# Altium schematic sheet 4_PP5V Bias.SchDoc
size A2; Date: Not shown in title block; ApprovedBy: Not shown in title block; CheckedBy: Not shown in title block; Author: Not shown in title block; CompanyName: Not shown in title block; Engineer: Not shown in title block; Organization: Not shown in title block; Address1: Not shown in title block; Address2: Not shown in title block; Address3: Not shown in title block; Address4: Not shown in title block; DocumentNumber: 1; Revision: Use project parameter SCH_Rev; SheetNumber: 1; SheetTotal: 1; PageSetup: Record=PageOptions|CenterHorizontal=True|CenterVertical=True|PrintScale=0.69|XCorrection=1.00|YCorrection=1.00|PrintKind=0|BorderSize=5000000|LeftOffset=0|BottomOffset=0|Orientation=2|PaperLength=1000|PaperWidth=1000|Scale=100|PaperSource=15|PrintQuality=600|MediaType=1|DitherType=10|PaperKind=Letter|PrintScaleMode=1; CurrentTime: Not shown in title block; CurrentDate: Not shown in title block; Time: Not shown in title block; DocumentFullPathAndName: Not shown in title block; DocumentName: Not shown in title block; ModifiedDate: Not shown in title block; ImagePath: Not shown in title block
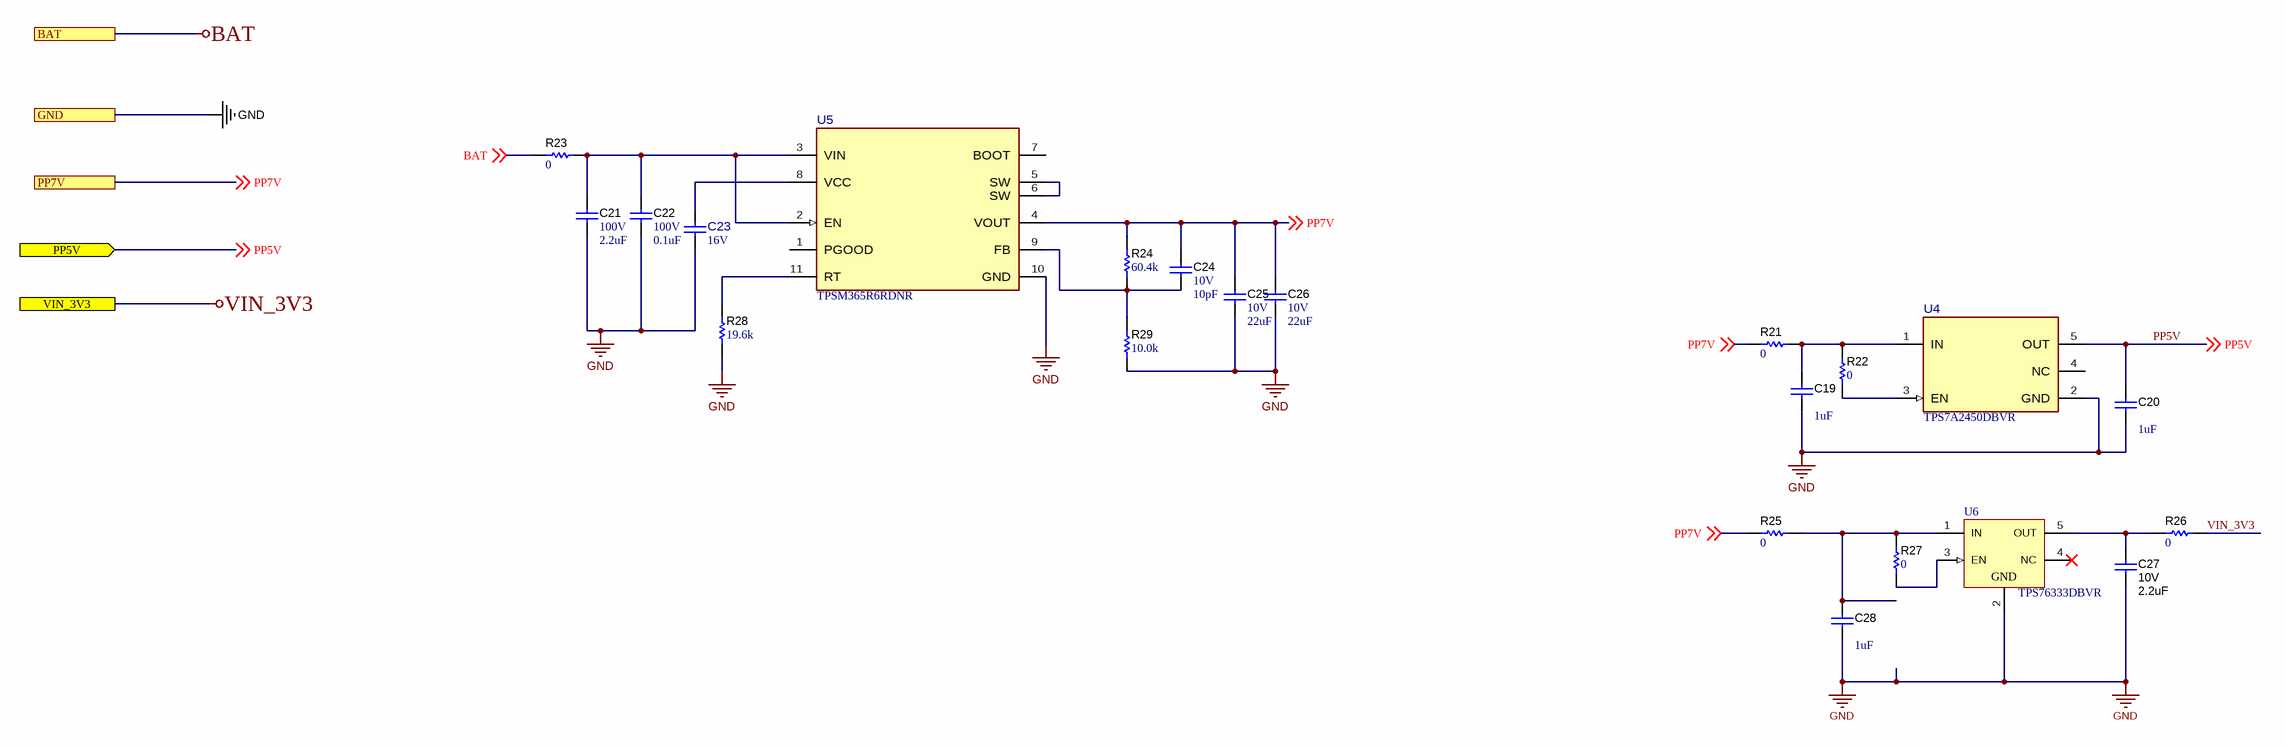
[diagram p0: 4_PP5V Bias.SchDoc]

## Parts
C19  ValueDisplayed: 1uF  [0805_HV]  (hidden comment: C2012X7S2A105K125AB)
C20  ValueDisplayed: 1uF  [0805_HV]  (hidden comment: C2012X7S2A105K125AB)
C21  VDC_V: 100V  ValueDisplayed: 2.2uF  [1206_180]  (hidden comment: C3216X7S2A225K160AB)
C22  VDC_V: 100V  ValueDisplayed: 0.1uF  [0402]  (hidden comment: GRM155R62A104KE14D)
C23  VDC_V: 16V  [FP-0402YD105KAT2A_0402-IPC_B]  (hidden comment: 0402YD105KAT2A)
C24  VDC_V: 10V  ValueDisplayed: 10pF  [0402]  (hidden comment: C0402C100C8GACTU)
C25  VDC_V: 10V  ValueDisplayed: 22uF  [0603]  (hidden comment: CL10A226MP8NUNE)
C26  VDC_V: 10V  ValueDisplayed: 22uF  [0603]  (hidden comment: CL10A226MP8NUNE)
C27  VDC_V: 10V  ValueDisplayed: 2.2uF  [0603]  (hidden comment: CGA3E3X5R1A225K080AB)
C28  ValueDisplayed: 1uF  [0805_HV]  (hidden comment: C2012X7S2A105K125AB)
R21  ValueDisplayed: 0  [0603]  (hidden comment: RC0603JR-070RL)
R22  ValueDisplayed: 0  [0402]  (hidden comment: CMP-0027004-2)
R23  ValueDisplayed: 0  [0402]  (hidden comment: CMP-0027004-2)
R24  ValueDisplayed: 60.4k  [0603]  (hidden comment: RT0603BRD0760K4L)
R25  ValueDisplayed: 0  [0603]  (hidden comment: RC0603JR-070RL)
R26  ValueDisplayed: 0  [0402]  (hidden comment: CMP-0027004-2)
R27  ValueDisplayed: 0  [0402]  (hidden comment: CMP-0027004-2)
R28  ValueDisplayed: 19.6k  [0402]  (hidden comment: CRCW040219K6FKED)
R29  ValueDisplayed: 10.0k  [0402]  (hidden comment: ERJ-2RKF1002X)
U4  TPS7A2450DBVR  [DBV0005A-MFG]
U5  TPSM365R6RDNR  [RDN0011A-MFG]
U6  TPS76333DBVR  [DBV0005A_N]

## Ports
BAT, GND, PP5V (in), PP7V, VIN_3V3

## Nets
BAT: R23.2 ; off-sheet BAT, port BAT
GND: C19.2 C20.2 C21.2 C22.2 C23.2 C25.2 C26.2 C27.2 C28.2 R28.1 R29.1 U4.2(GND) U5.10(GND) U6.2(GND) ; port GND
VIN_3V3: R26.1 ; port VIN_3V3
PP5V: C20.1 U4.5(OUT) ; off-sheet PP5V, port PP5V
PP7V: C24.1 C25.1 C26.1 R21.1 R24.2 R25.1 U5.4(VOUT) ; off-sheet PP7V, port PP7V
NetC19_1: C19.1 R21.2 R22.2 U4.1(IN)
NetC21_1: C21.1 C22.1 R23.1 U5.2(EN) U5.3(VIN)
NetC23_1: C23.1 U5.8(VCC)
NetC24_2: C24.2 R24.1 R29.2 U5.9(FB)
NetC27_1: C27.1 R26.2 U6.5(OUT)
NetC28_1: C28.1 R25.2 R27.2 U6.1(IN)
NetR22_1: R22.1 U4.3(EN)
NetR27_1: R27.1 U6.3(EN)
NetR28_2: R28.2 U5.11(RT)
NetU5_5: U5.5(SW) U5.6(SW)

Not connected (* = marked no-connect by the designer): U4 4(NC); U5 1(PGOOD) 7(BOOT); U6 4(NC)*

## Notes on the sheet
- Orderable:
- Designed for:
- Mod. Date:
- Texas Instruments and/or its licensors do not warrant the accuracy or completeness of this specification or any information contained therein. Texas Instruments and/or its licensors do not warrant that this design will meet the specifications, will be suitable for your application or fit for any particular purpose, or will operate in an implementation. Texas Instruments and/or its licensors do not warrant that the design is production worthy. You should completely validate and test your design implementation to confirm the system functionality for your application.
- Drawn By:
- Engineer:
- SVN Rev:
- Number:
- TID #:
- Rev:
- Sheet Title:
- File:
- Contact:
- Project Title:
- Assembly Variant:
- Sheet:
- Size:
- of
- A2
- © Texas Instruments
- http://www.ti.com

## Library data of the parts
C19 C20 C28 = CMP-0007891-2: CAP, CERM, 1 uF, 100 V, +/- 10%, X7S, 0805; Manufacturer: TDK; TaMin_C: -55°C; Polarized: N; SizeAreaWB_mm2: 6.75; Value1: 0.008255 ohm; U/M: EA; Value: 1uF; TaMax_C: 125°C; SizeZ_mm: 1.45; SizeX_mm: 2; SizeY_mm: 1.25; Cap_Case: 0805; Value2: 100V; SizeArea_mm2: 2.5; Cap_F: 1µF; AEC Category: Q200; ESR_ohm: 8.255m; IRMS_A: 2.2744A; Supplier Part Number 2: 90R8332; Publisher: Texas Instruments; Supplier 2: Newark; Supplier Part Number 3: 810-C2012X7S2A105K; TempCo: X7S; Supplier 3: Mouser; Published: 2008-06-19; RoHS: Y; MountType: SMT; Supplier 1: Digi-Key; PackageReference: 0805; Tolerance_%: 10%; CompType: Capacitor; LatestRevisionDate: 2017-03-09; PartNumber: C2012X7S2A105K125AB; AEC Qualified: N; VDC_V: 100V; ComponentLink1Description: Datasheet link; Supplier Part Number 1: 445-5205-1-ND; Technology: Ceramic; ComponentLink1URL: https://product.tdk.com/en/search/capacitor/ceramic/mlcc/info?part_no=C2012X7S2A105K125AB; AEC Grade: N/A
C21 = CMP-0008724-2: CAP, CERM, 2.2 uF, 100 V, +/- 10%, X7S, 1206; Manufacturer: TDK; TaMin_C: -55°C; ESR_ohm: 5.718m; Polarized: N; SizeAreaWB_mm2: 10.92; Value1: 0.005718 ohm; U/M: EA; Value: 2.2uF; TaMax_C: 125°C; SizeZ_mm: 1.8; SizeX_mm: 3.2; SizeY_mm: 1.6; SizeArea_mm2: 5.12; Cap_F: 2.2µF; IRMS_A: 3.0363A; AEC Category: Q200; Supplier Part Number 2: 810-C3216X7S2A225K160AB; Publisher: Texas Instruments; Supplier 2: Mouser; TempCo: X7S; Published: 2008-06-19; RoHS: Y; MountType: SMT; Supplier 1: Digi-Key; PackageReference: 1206; Tolerance_%: 10%; Cap_Case: 1206_180; Value2: 100V; CompType: Capacitor; LatestRevisionDate: 2017-03-09; PartNumber: C3216X7S2A225K160AB; AEC Qualified: N; ComponentLink1Description: Datasheet link; AEC Grade: N/A; Supplier Part Number 1: 445-5207-1-ND; Technology: Ceramic; ComponentLink1URL: https://product.tdk.com/en/search/capacitor/ceramic/mlcc/info?part_no=C3216X7S2A225K160AB
C22 = CMP-0006618-1: CAP, CERM, 0.1 uF, 100 V, +/- 10%, X5R, 0402; Manufacturer: MuRata; TaMin_C: -55°C; Polarized: N; SizeAreaWB_mm2: 3; Value1: Unknown; U/M: EA; Value: 0.1uF; TaMax_C: 85°C; SizeZ_mm: 0.6; SizeX_mm: 1; SizeY_mm: 0.5; Cap_F: 100nF; AEC Category: Q200; ComponentLink1URL: http://psearch.en.murata.com/capacitor/product/GRM155R62A104KE14%23.pdf; Supplier Part Number 2: 96Y9228; Publisher: Texas Instruments; Supplier 2: Newark; Supplier Part Number 3: 81-GRM155R62A104KE4D; TempCo: X5R; Supplier 3: Mouser; Published: 2008-06-19; RoHS: Y; MountType: SMT; Supplier 1: Digi-Key; PackageReference: 0402; Tolerance_%: 10%; Cap_Case: 0402; Value2: 100V; SizeArea_mm2: 0.5; CompType: Capacitor; LatestRevisionDate: 2017-03-09; PartNumber: GRM155R62A104KE14D; AEC Qualified: N; ComponentLink1Description: Datasheet link; AEC Grade: N/A; Supplier Part Number 1: 490-10458-1-ND; Technology: Ceramic
C23 = CMP-00860000-2: CAPACITOR, X5R, 0402, 16V, 1UF; Manufacturer: AVX; SizeZ_mm: 0.56mm; Value: 1µF; TempCo: 15%; Tolerance_%: 10%; AEC Qualified: No; Symbol Name: SYM-0402YD105KAT2A; ComponentLink1URL: http://datasheets.avx.com/cx5r.pdf; PackageReference: 0402; PartNumber: 0402YD105KAT2A; ComponentLink1Description: Datasheet; RoHS: TRUE
C24 = CMP-0064914-1: CAP, CERM, 10 pF, 10 V,+/- 2.5%, C0G/NP0, 0402; Manufacturer: Kemet; TaMin_C: -55°C; Polarized: N; SizeAreaWB_mm2: 3; Value1: Unknown; U/M: EA; Value: 10pF; TaMax_C: 125°C; SizeZ_mm: 0.6; SizeX_mm: 1; SizeY_mm: 0.5; AEC Category: Q200; ComponentLink1URL: http://www.kemet.com/docfinder?Partnumber=C0402C100C8GACTU; Supplier Part Number 2: 96Y6847; Publisher: Texas Instruments; Supplier 2: Newark; Supplier Part Number 3: 80-C0402C100C8G; TempCo: C0G/NP0; Supplier 3: Mouser; Published: 2008-06-19; RoHS: Y; MountType: SMT; Supplier 1: Digi-Key; PackageReference: 0402; Tolerance_%: 2.5%; Cap_Case: 0402; Value2: 10V; SizeArea_mm2: 0.5; CompType: Capacitor; LatestRevisionDate: 2017-06-05; PartNumber: C0402C100C8GACTU; AEC Qualified: N; Cap_F: 10pF; ComponentLink1Description: Datasheet link; AEC Grade: N/A; Supplier Part Number 1: 399-8939-1-ND; Technology: Ceramic
C25 C26 = CMP-0007108-2: CAP, CERM, 22 uF, 10 V, +/- 20%, X5R, 0603; Manufacturer: Samsung Electro-Mechanics; TaMin_C: -55°C; Polarized: N; SizeAreaWB_mm2: 4.68; Value1: Unknown; U/M: EA; Value: 22uF; TaMax_C: 85°C; SizeZ_mm: 1; SizeX_mm: 1.6; SizeY_mm: 0.8; SizeArea_mm2: 1.28; Cap_F: 22µF; AEC Category: Q200; Publisher: Texas Instruments; TempCo: X5R; Published: 2008-06-19; RoHS: Y; MountType: SMT; PackageReference: 0603; Tolerance_%: 20%; Cap_Case: 0603; Value2: 10V; CompType: Capacitor; LatestRevisionDate: 2017-03-09; PartNumber: CL10A226MP8NUNE; AEC Qualified: ?; ComponentLink1Description: Datasheet link; Technology: Ceramic; ComponentLink1URL: http://www.samsungsem.com/servlet/FileDownload?type=spec&file=CL10A226MP8NUNE.pdf
C27 = CMP-0007091-5: CAP, CERM, 2.2 uF, 10 V, +/- 10%, X5R, AEC-Q200 Grade 3, 0603; Manufacturer: TDK; TaMin_C: -55°C; Polarized: N; SizeAreaWB_mm2: 4.68; Value1: Unknown; U/M: EA; Value: 2.2uF; TaMax_C: 85°C; SizeZ_mm: 1; SizeX_mm: 1.6; SizeY_mm: 0.8; SizeArea_mm2: 1.28; AEC Qualified: Y; Cap_F: 2.2µF; AEC Grade: 3; AEC Category: Q200; ComponentLink1URL: https://product.tdk.com/info/en/documents/chara_sheet/CGA3E3X5R1A225K080AB.pdf; Publisher: Texas Instruments; Supplier 2: Newark; Supplier Part Number 3: 810-CGA3E3X5R1A225KB; TempCo: X5R; Supplier 3: Mouser; Published: 2008-06-19; RoHS: Y; MountType: SMT; Supplier 1: Digi-Key; PackageReference: 0603; Tolerance_%: 10%; Cap_Case: 0603; Value2: 10V; CompType: Capacitor; LatestRevisionDate: 2017-03-09; PartNumber: CGA3E3X5R1A225K080AB; ComponentLink1Description: Datasheet link; Supplier Part Number 1: 445-12444-1-ND; Technology: Ceramic
R21 R25 = CMP-0025885-5: RES, 0, 5%, 0.1 W, 0603; Manufacturer: Yageo; Power_W: 100mW; TempCo: 200 ppm/C; Value_Code: 0000; Value: 0; EIA_Code: E24; SizeX_mm: 1.6; SizeZ_mm: 1; Value2: 0.1W; SizeArea_mm2: 1.28; AEC Qualified: N; VDC_V: 75V; AEC Category: Q200; SizeY_mm: 0.8; SizeAreaWB_mm2: 4.68; Supplier Part Number 2: 603-RC0603JR-070RL; Supplier 2: Mouser; Supplier Part Number 3: 9233130; Supplier 3: Farnell; RoHS: Y; Value1: 5%; MountType: SMT; Supplier 1: Digi-Key; PackageReference: 0603; Tolerance_%: 5%; Res_ohm: 0; CompType: Resistor; PartNumber: RC0603JR-070RL; ComponentLink1Description: Datasheet link; Supplier Part Number 1: 311-0.0GRCT-ND; Technology: Thick Film; ComponentLink1URL: http://www.yageo.com/pdf/Pu-RC0603_51_PbFree_L_2.pdf; AEC Grade: N/A
R22 R23 R26 R27 = CMP-0027004-2: RES, 0, 5%, 0.063 W, 0402; PartNumber: RC0402JR-070RL; Manufacturer: Yageo America; Value: 0; Value_Code: 0000; Power_W: 63mW; Value2: 0.063W; VDC_V: 50V; TempCo: 200 ppm/C; SizeArea_mm2: 0.5; SizeX_mm: 1; SizeZ_mm: 0.6; EIA_Code: E24; U/M: EA; AEC Category: Q200; CompType: Resistor; PackageReference: 0402; RoHS: Y; Res_ohm: 0; Tolerance_%: 5%; Value1: 5%; MountType: SMT; Technology: Thick Film; SizeY_mm: 0.5; Published: 2008-06-26; Publisher: Texas Instruments; LatestRevisionDate: 2017-03-09; ComponentLink1Description: Datasheet link; ComponentLink1URL: http://www.yageo.com/pdf/Pu-RC0402_51_PbFree_L_2.pdf; Supplier 1: Digi-Key; Supplier Part Number 1: 311-0.0JRCT-ND; Supplier 2: Mouser; Supplier Part Number 2: 603-RC0402JR-070RL; Supplier 3: Farnell; Supplier Part Number 3: 9232516; AEC Qualified: ?
R24 = CMP-0024382-2: RES, 60.4 k, 0.1%, 0.1 W, 0603; Manufacturer: Yageo America; Power_W: 100mW; TempCo: 25 ppm/C; Value_Code: 60k4; U/M: EA; Value: 60.4k; EIA_Code: E192; SizeX_mm: 1.6; SizeY_mm: 0.8; SizeZ_mm: 1; Value2: 0.1W; SizeArea_mm2: 1.28; VDC_V: 75V; AEC Category: Q200; Publisher: Texas Instruments; Published: 2008-06-26; RoHS: Y; Value1: 0.1%; MountType: SMT; PackageReference: 0603; Tolerance_%: 0.1%; Res_ohm: 60.4k; CompType: Resistor; LatestRevisionDate: 2017-03-09; PartNumber: RT0603BRD0760K4L; AEC Qualified: ?; ComponentLink1Description: Datasheet link; Technology: Thin Film; ComponentLink1URL: http://www.yageo.com/pdf/PYu-RT_1-to-0.05_RoHS_L_3.pdf
R28 = CMP-0026068-2: RES, 19.6 k, 1%, 0.063 W, 0402; Manufacturer: Vishay-Dale; Power_W: 63mW; TempCo: 100 ppm/C; Value_Code: 19k6; U/M: EA; Value: 19.6k; EIA_Code: E96; SizeX_mm: 1; SizeY_mm: 0.5; SizeZ_mm: 0.6; Value2: 0.063W; VDC_V: 50V; AEC Category: Q200; Supplier Part Number 2: 52K6774; Publisher: Texas Instruments; Supplier 2: Newark; Supplier Part Number 3: 71-CRCW0402-19.6K-E3; Supplier 3: Mouser; Published: 2008-06-26; RoHS: Y; Value1: 1%; MountType: SMT; Supplier 1: Digi-Key; PackageReference: 0402; Tolerance_%: 1%; Res_ohm: 19.6k; SizeArea_mm2: 0.5; CompType: Resistor; LatestRevisionDate: 2017-03-09; PartNumber: CRCW040219K6FKED; AEC Qualified: ?; ComponentLink1Description: Datasheet link; Supplier Part Number 1: 541-19.6KLCT-ND; Technology: Thick Film; ComponentLink1URL: http://www.vishay.com/docs/20035/dcrcwe3.pdf
R29 = CMP-0026658-1: RES, 10.0 k, 1%, 0.1 W, 0402; Manufacturer: Panasonic; Power_W: 100mW; TempCo: 100 ppm/C; Value_Code: 10k0; U/M: EA; Value: 10.0k; EIA_Code: E96; Res_ohm: 10k; SizeX_mm: 1; SizeY_mm: 0.5; SizeZ_mm: 0.6; Value2: 0.1W; VDC_V: 50V; AEC Category: Q200; ComponentLink1URL: http://industrial.panasonic.com/www-data/pdf/AOA0000/AOA0000CE2.pdf; Supplier Part Number 2: 90W2949; Publisher: Texas Instruments; Supplier 2: Newark; Supplier Part Number 3: 667-ERJ-2RKF1002X; Supplier 3: Mouser; Published: 2008-06-26; RoHS: Y; Value1: 1%; MountType: SMT; Supplier 1: Digi-Key; PackageReference: 0402; Tolerance_%: 1%; SizeArea_mm2: 0.5; CompType: Resistor; LatestRevisionDate: 2017-03-09; PartNumber: ERJ-2RKF1002X; AEC Qualified: ?; ComponentLink1Description: Datasheet link; Supplier Part Number 1: P10.0KLCT-ND; Technology: Thick Film
U4 = CMP-0096923-1: Linear Voltage Regulator IC  1 Output  200mA SOT-23-5; Manufacturer: Texas Instruments; AEC Qualified: No; Standoff Height: 0mm; Accuracy Percentage: 2%; SizeZ_mm: 1.45mm; Number Of Outputs: 1; TJmax_C: +125°C; Max Supply Voltage: 18V; Output Type: Fixed; Nominal Supply Current: 2-15uA; Dropout Voltage: 160mV; Output Voltage: 5V; Min Supply Voltage: 2.4V; Datasheet Path: datasheets/IC-TPS7A2450DBVR.pdf; Operating Temperature Range: -40°C to +125°C; PackageReference: SOT23-5; ComponentLink1Description: Datasheet; datasheet: https://www.ti.com/lit/ds/symlink/tps7a24.pdf?ts=1612198841338&ref_url=https%253A%252F%252Fwww.ti.com%252Fproduct%252FTPS7A24%253FkeyMatch%253DTPS7A2450DBVR%2526tisearch%253DSearch-EN-everything%2526usecase%253DOPN; ComponentLink1URL: https://www.ti.com/lit/ds/symlink/tps7a24.pdf?ts=1612198841338&ref_url=https%253A%252F%252Fwww.ti.com%252Fproduct%252FTPS7A24%253FkeyMatch%253DTPS7A2450DBVR%2526tisearch%253DSearch-EN-everything%2526usecase%253DOPN; PartNumber: TPS7A2450DBVR; Mouser Part Number: 595-TPS7A2450DBVR; RoHS: TRUE; Mouser Description: 200-mA, 18-V, ultra-low-IQ, low-dropout (LDO) voltage regulator with enable 5-SOT-23 -40 to 125; helpURL: https://upverter.com/upn/revision/aa9411556fc6a2cf/; Digikey Description: IC REG LINEAR 5V 200MA SOT23-5; Part Number: TPS7A2450DBVR; Lead Free: Yes; Digikey Part Number: 296-TPS7A2450DBVRCT-ND
U5 = CMP-0096774-1: 3 V to 65 V Input, 1 V to 13 V Output, 600-mA Synchronous Buck Converter Power Module in a HotRod™ QFN Package; Manufacturer: Texas Instruments; Min Supply Voltage: 3.6V; Output Voltage: 1-13V; Max Duty Cycle: 98%; Output Type: AdjustableProgrammable; SizeZ_mm: 2.1mm; Switching Frequency: 200-2200kHz; AEC Qualified: No; Nominal Supply Current: 17-18uA; Standoff Height: 0mm; Number Of Outputs: 1; Max Supply Voltage: 65V; TJmax_C: +125°C; RoHS: UNKNOWN; Switching Topology: Buck; Part Number: TPSM365R6RDNR; helpURL: https://upverter.com/upn/revision/f14bde8c92c41f4a/; PackageReference: QFN-FCMOD11; PartNumber: TPSM365R6RDNR; Datasheet Path: datasheets/IC-TPSM365R6RDNR.pdf; Operating Temperature Range: -40°C to +125°C
U6 = CMP-0035539-1: Single Output LDO, 150 mA, Fixed 3.3 V Output, 2.7 to 10 V Input, with Low IQ, 5-pin SOT-23 (DBV), -40 to 125 degC, Green (RoHS & no Sb/Br); Manufacturer: Texas Instruments; Fixed Output Options(V): 3.3; SubFamily: Single Channel LDO; Vdo(Typ)(mV): 300; Accuracy(%): 3; Vin(Max)(V): 10; Iq(Typ)(mA): 0.08; Vin(Min)(V): 2.7; Iout(Max)(A): 0.15; ComponentLink3Description: Package Specification; Vout Adj(Max)(V): 3.3; ComponentLink2Description: Datasheet; PackageReference: DBV0005A; PartNumber: TPS76333DBVR; ComponentLink1URL: http://www.ti.com/; ComponentLink2URL: http://www.ti.com/general/docs/lit/getliterature.tsp?genericPartNumber=TPS76333&fileType=pdf; Mounting Technology: Surface Mount; PackageVersion: 4073253-4/K; Code_JEDEC: MO-178; Eco-Plan: Green (RoHS & no Sb/Br); DatasheetVersion: SLVS181H; ComponentLink1Description: Manufacturer URL; ComponentLink3URL: http://www.ti.com/litv/pdf/mpds018i; Vout Adj(Min)(V): 3.3; PackageDescription: 5-Pin Plastic Small Outline, Body 1.60 Ãƒâ€” 2.90 mm, Pitch 0.95 mm